# Altium project OFP_VIM_v1.5.2.PrjPcb (part 1 of 3)
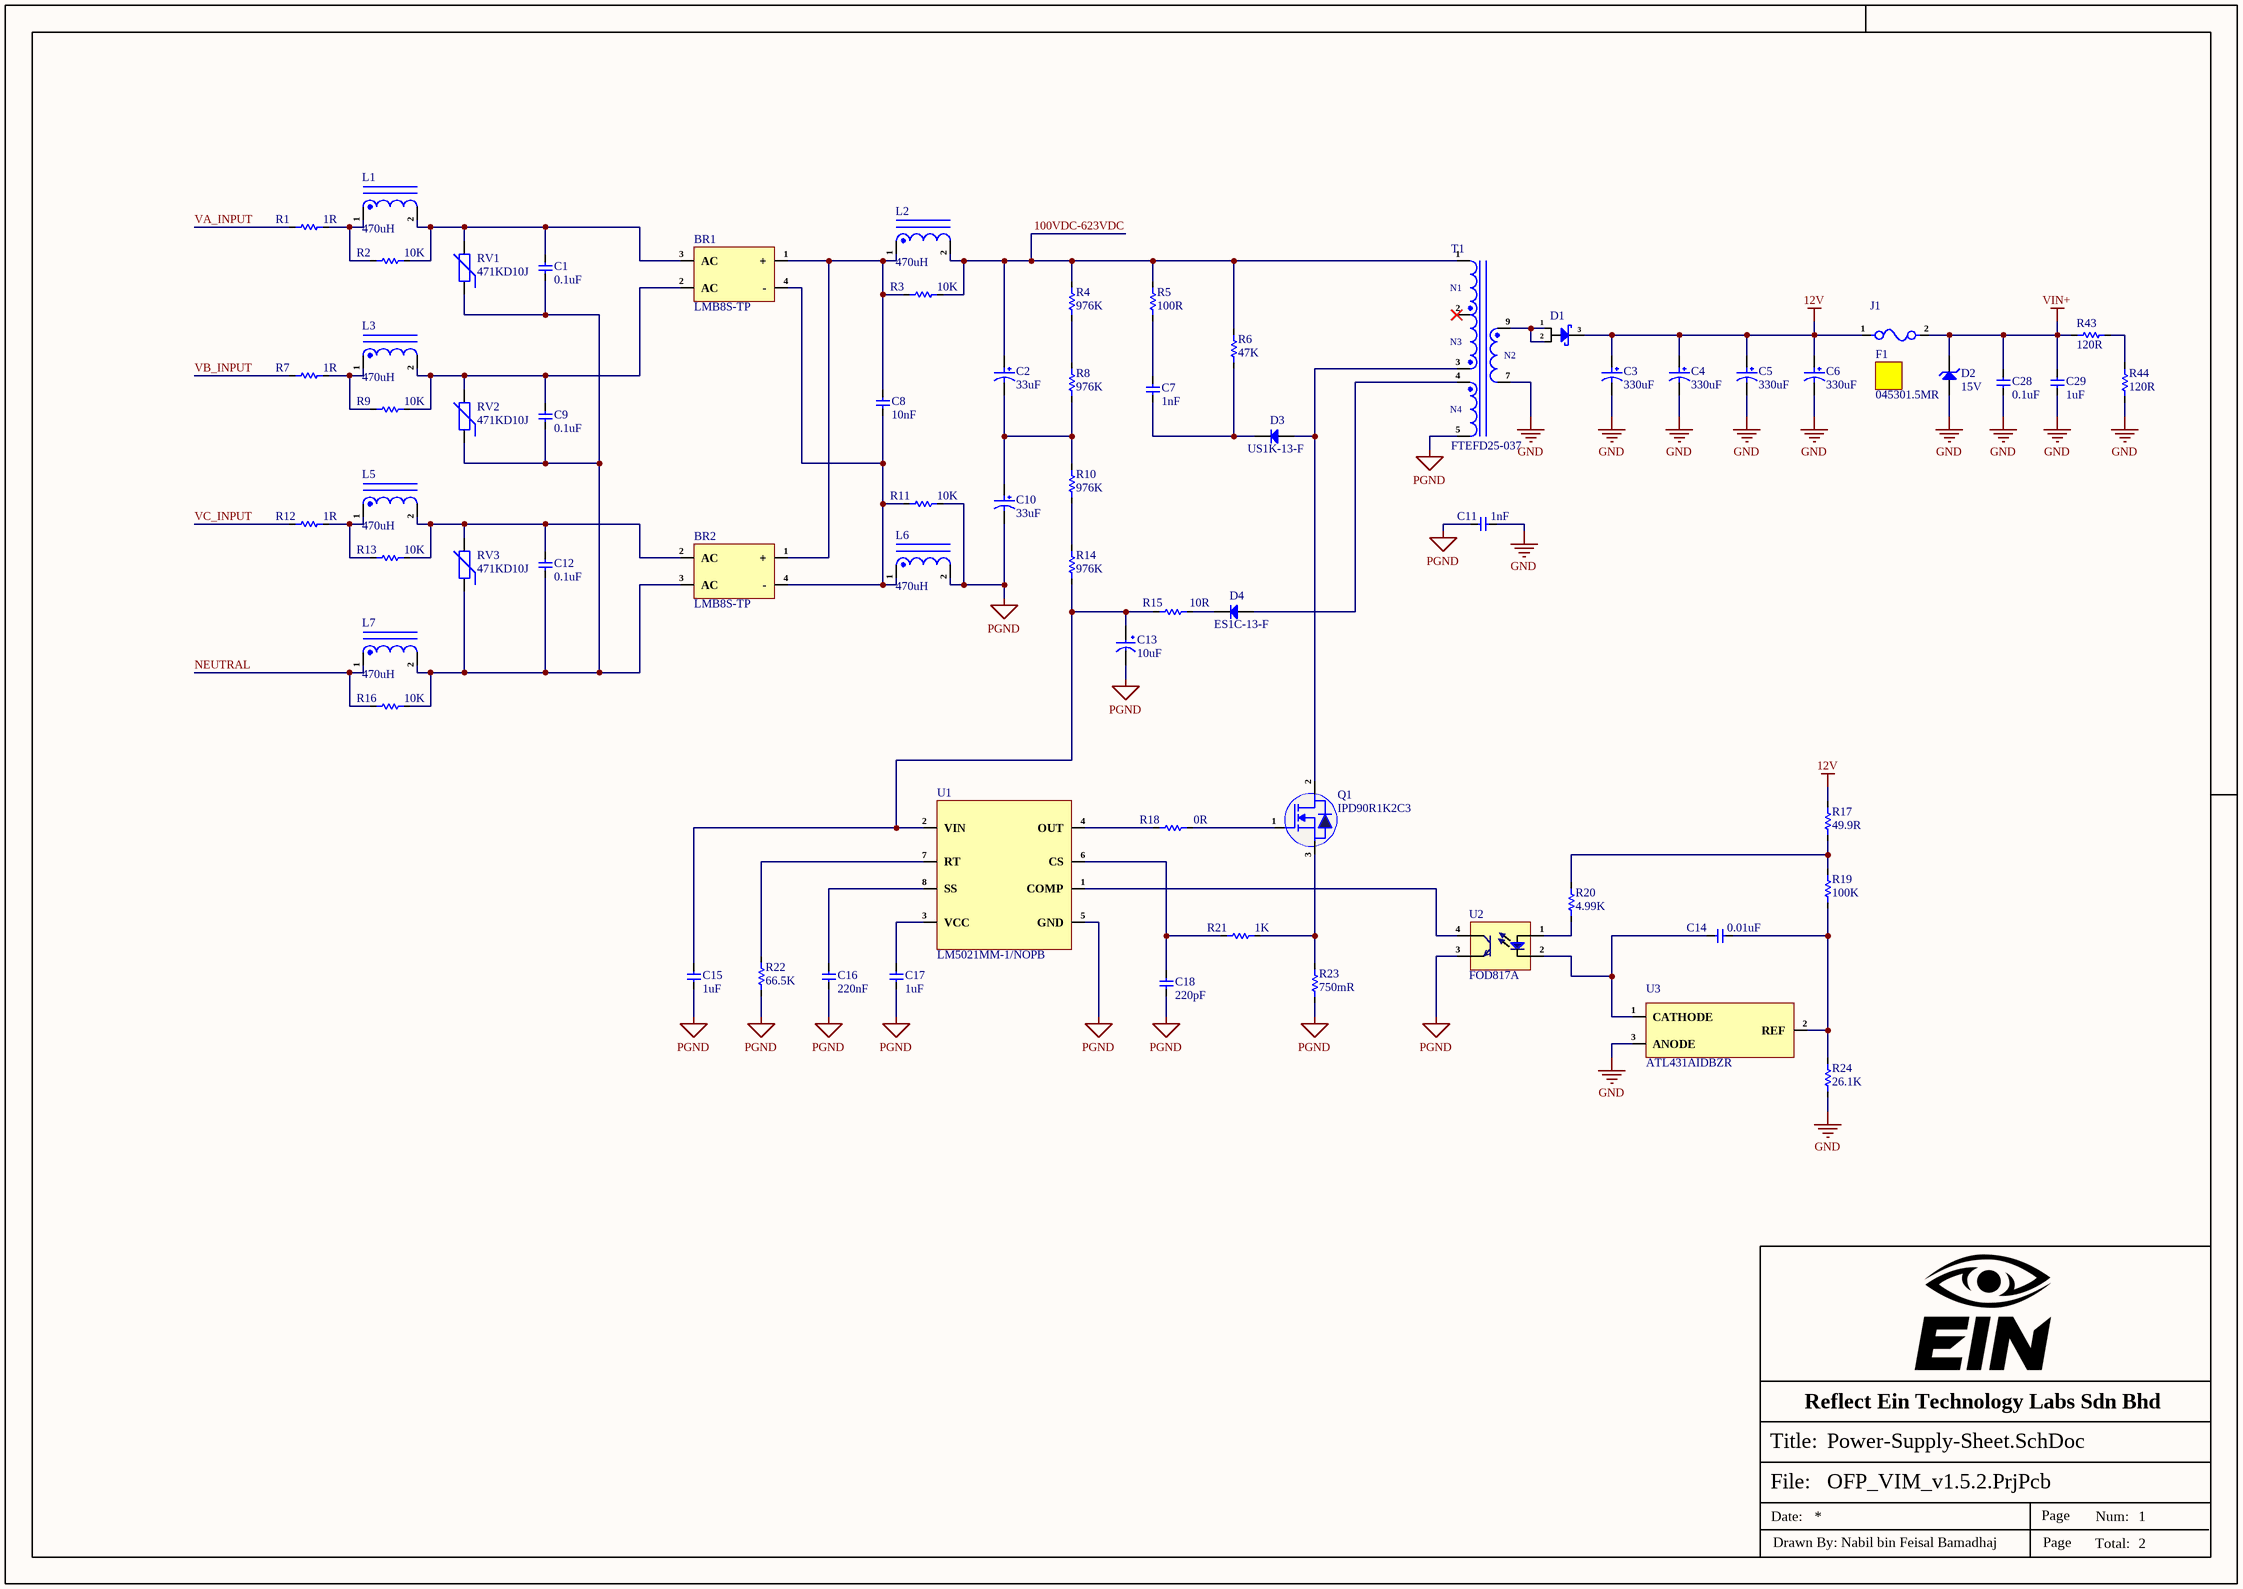
[diagram p0: Power-Supply-Sheet.SchDoc]
2 sheets, 102 parts. Net scope: global (net labels, ports and power ports of the same name join across sheets).
Board file: OFP_VIM_v1.5.2.PcbDoc
Sheets:
  Power-Supply-Sheet.SchDoc
  INPUT-Connectors-Sheet.SchDoc

## Sheet Power-Supply-Sheet.SchDoc
size 420 x 297 mm; SheetNumber: 1; SheetTotal: 2

### Parts
BR1  LMB8S-TP  [LMBS-1]
BR2  LMB8S-TP  [LMBS-1]
C1  0.1uF  [B32921C3104M000]
C2  33uF  [87EC0494]
C3  330uF  [GVM1E331M0607]
C4  330uF  [GVM1E331M0607]
C5  330uF  [GVM1E331M0607]
C6  330uF  [GVM1E331M0607]
C7  1nF  [Cap-1206]
C8  10nF  [KP103J1000VP15]
C9  0.1uF  [B32921C3104M000]
C10  33uF  [87EC0494]
C11  1nF  [VY2102M29Y5US6TV7]
C12  0.1uF  [B32921C3104M000]
C13  10uF  [Case-C]
C14  0.01uF  [Cap-0603]
C15  1uF  [Cap-0603]
C16  220nF  [Cap-0603]
C17  1uF  [Cap-0603]
C18  220pF  [Cap-0603]
C28  0.1uF  [Cap-0805]
C29  1uF  [Cap-0603]
D1  FSV20150V  [TO-277A]  (value not drawn)
D2  15V  [SOD-123W]
D3  US1K-13-F  [SMA]
D4  ES1C-13-F  [SMA]
F1  045301.5MR  (mechanical)
J1  01550900M  [01550900M]  (value not drawn)
L1  470uH  [PK0810-471MB]
L2  470uH  [PK0810-471MB]
L3  470uH  [PK0810-471MB]
L5  470uH  [PK0810-471MB]
L6  470uH  [PK0810-471MB]
L7  470uH  [PK0810-471MB]
Q1  IPD90R1K2C3  [TO-252-2L]
R1  1R  [FMP200JR-52-1R]
R2  10K  [Res-1206]
R3  10K  [Res-1206]
R4  976K  [Res-1206]
R5  100R  [RES-2010]
R6  47K  [RES-2512]
R7  1R  [FMP200JR-52-1R]
R8  976K  [Res-1206]
R9  10K  [Res-1206]
R10  976K  [Res-1206]
R11  10K  [Res-1206]
R12  1R  [FMP200JR-52-1R]
R13  10K  [Res-1206]
R14  976K  [Res-1206]
R15  10R  [Res-1206]
R16  10K  [Res-1206]
R17  49.9R  [Res-0603]
R18  0R  [Res-0805]
R19  100K  [Res-0603]
R20  4.99K  [Res-0603]
R21  1K  [Res-0603]
R22  66.5K  [Res-0603]
R23  750mR  [Res-1206]
R24  26.1K  [Res-0603]
R43  120R  [RES-2512]
R44  120R  [RES-2512]
RV1  471KD10J  [471KD10J]
RV2  471KD10J  [471KD10J]
RV3  471KD10J  [471KD10J]
T1  FTEFD25-037  [FTEFD25-037]
U1  LM5021MM-1/NOPB  [8-VSSOP (Pitch 0.65mm)(5x3.1mm)]
U2  FOD817A  [DIP-4]
U3  ATL431AIDBZR  [SOT-23]

### Nets
12V: C3.1 C4.1 C5.1 C6.1 D1.3(K) J1.1 R17.2
GND: C3.2 C4.2 C5.2 C6.2 C11.2 C28.1 C29.1 D2.1(A) R24.1 R44.1 T1.7 U3.3(ANODE)
PGND: C10.2 C11.1 C13.2 C15.1 C16.1 C17.1 C18.1 L6.2 R11.2 R22.1 R23.1 T1.5 U1.5(GND) U2.3(E)
VIN+: C28.2 C29.2 D2.2(K) J1.2 R43.1
100VDC-623VDC: C2.1 L2.2 R3.2 R4.2 R5.2 R6.2 T1.1
NEUTRAL: L7.1 R16.1
VA_INPUT: R1.1
VB_INPUT: R7.1
VC_INPUT: R12.1
NetBR1_1: BR1.1(+) BR2.1(+) C8.2 L2.1 R3.1
NetBR1_2: BR1.2(AC) C9.2 L3.2 R9.2 RV2.2
NetBR1_3: BR1.3(AC) C1.2 L1.2 R2.2 RV1.2
NetBR1_4: BR1.4(-) BR2.4(-) C8.1 L6.1 R11.1
NetBR2_2: BR2.2(AC) C12.2 L5.2 R13.2 RV3.2
NetBR2_3: BR2.3(AC) C1.1 C9.1 C12.1 L7.2 R16.2 RV1.1 RV2.1 RV3.1
NetC2_2: C2.2 C10.1 R8.1 R10.2
NetC7_1: C7.1 D3.1(K) R6.1
NetC7_2: C7.2 R5.1
NetC13_1: C13.1 C15.2 R14.1 R15.1 U1.2(VIN)
NetC14_1: C14.1 R19.1 R24.2 U3.2(REF)
NetC14_2: C14.2 U2.2(Ca) U3.1(CATHODE)
NetC16_2: C16.2 U1.8(SS)
NetC17_2: C17.2 U1.3(VCC)
NetC18_2: C18.2 R21.1 U1.6(CS)
NetD1_1: D1.1(A) D1.2(A) T1.9
NetD3_2: D3.2(A) Q1.2(D) T1.3
NetD4_1: D4.1(K) R15.2
NetD4_2: D4.2(A) T1.4
NetL1_1: L1.1 R1.2 R2.1
NetL3_1: L3.1 R7.2 R9.1
NetL5_1: L5.1 R12.2 R13.1
NetQ1_1: Q1.1(G) R18.2
NetQ1_3: Q1.3(S) R21.2 R23.2
NetR4_1: R4.1 R8.2
NetR10_1: R10.1 R14.2
NetR17_1: R17.1 R19.2 R20.2
NetR18_1: R18.1 U1.4(OUT)
NetR20_1: R20.1 U2.1(An)
NetR22_2: R22.2 U1.7(RT)
NetR43_2: R43.2 R44.2
NetU1_1: U1.1(COMP) U2.4(C)

Not connected (* = marked no-connect by the designer): T1 2*

### Notes on the sheet
- Reflect Ein Technology Labs Sdn Bhd
- File:
- Title:
- Date:
- Page
- Num:
- Total:
- Drawn By: Nabil bin Feisal Bamadhaj
- (in symbol FTEFD25-037) N1; N3; N2; N4